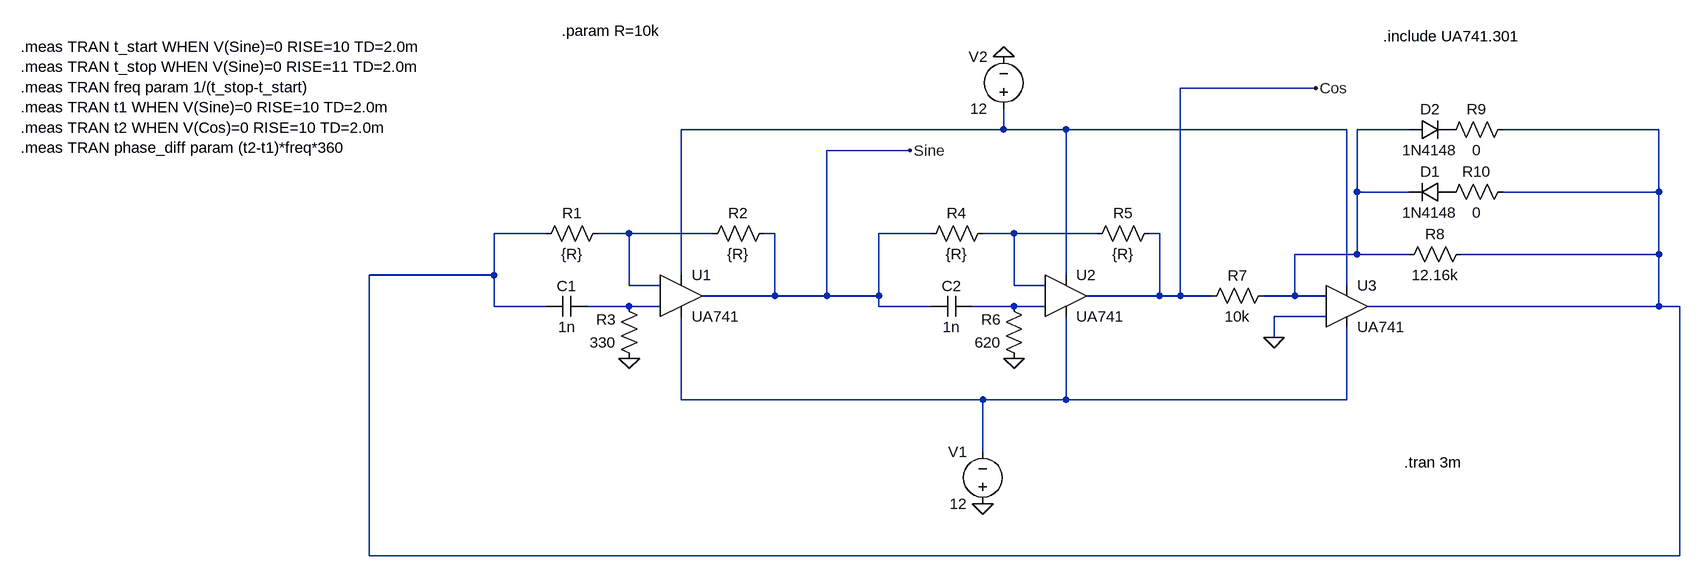
[diagram p0: schematic Quadrature_Oscillator.asc]
Quadrature_Oscillator.asc, the LTspice schematic file:
Version 4.1
SHEET 1 1748 680
WIRE 1120 -176 912 -176
WIRE 640 -112 640 -144
WIRE 640 -112 144 -112
WIRE 736 -112 640 -112
WIRE 1168 -112 736 -112
WIRE 1264 -112 1184 -112
WIRE 1648 -112 1408 -112
WIRE 496 -80 368 -80
WIRE 1184 -16 1184 -112
WIRE 1264 -16 1184 -16
WIRE 1648 -16 1648 -112
WIRE 1648 -16 1408 -16
WIRE -64 48 -144 48
WIRE 64 48 16 48
WIRE 192 48 64 48
WIRE 288 48 272 48
WIRE 528 48 448 48
WIRE 656 48 608 48
WIRE 784 48 656 48
WIRE 880 48 864 48
WIRE 1184 80 1184 -16
WIRE 1184 80 1088 80
WIRE 1264 80 1184 80
WIRE 1648 80 1648 -16
WIRE 1648 80 1344 80
WIRE -144 112 -144 48
WIRE -144 112 -336 112
WIRE 144 112 144 -112
WIRE 736 112 736 -112
WIRE 64 128 64 48
WIRE 112 128 64 128
WIRE 656 128 656 48
WIRE 704 128 656 128
WIRE 1168 128 1168 -112
WIRE 288 144 288 48
WIRE 288 144 176 144
WIRE 368 144 368 -80
WIRE 368 144 288 144
WIRE 448 144 448 48
WIRE 448 144 368 144
WIRE 880 144 880 48
WIRE 880 144 768 144
WIRE 912 144 912 -176
WIRE 912 144 880 144
WIRE 960 144 912 144
WIRE 1088 144 1088 80
WIRE 1088 144 1040 144
WIRE 1136 144 1088 144
WIRE -144 160 -144 112
WIRE -64 160 -144 160
WIRE 64 160 0 160
WIRE 112 160 64 160
WIRE 448 160 448 144
WIRE 528 160 448 160
WIRE 656 160 592 160
WIRE 704 160 656 160
WIRE 1648 160 1648 80
WIRE 1648 160 1200 160
WIRE 1680 160 1648 160
WIRE 1136 176 1056 176
WIRE 1056 208 1056 176
WIRE 144 304 144 176
WIRE 608 304 144 304
WIRE 736 304 736 176
WIRE 736 304 608 304
WIRE 1168 304 1168 192
WIRE 1168 304 736 304
WIRE 608 384 608 304
WIRE -336 544 -336 112
WIRE 1680 544 1680 160
WIRE 1680 544 -336 544
FLAG 64 240 0
FLAG 656 240 0
FLAG 496 -80 Sine
FLAG 1120 -176 Cos
FLAG 608 464 0
FLAG 640 -224 0
FLAG 1056 208 0
SYMBOL UA741 144 80 R0
SYMATTR InstName U1
SYMBOL res 32 32 R90
WINDOW 0 0 56 VBottom 2
WINDOW 3 32 56 VTop 2
SYMATTR InstName R1
SYMATTR Value {R}
SYMBOL res 288 32 R90
WINDOW 0 0 56 VBottom 2
WINDOW 3 32 56 VTop 2
SYMATTR InstName R2
SYMATTR Value {R}
SYMBOL cap -64 176 R270
WINDOW 0 32 32 VTop 2
WINDOW 3 0 32 VBottom 2
SYMATTR InstName C1
SYMATTR Value 1n
SYMBOL res 80 256 R180
WINDOW 0 36 76 Left 2
WINDOW 3 36 40 Left 2
SYMATTR InstName R3
SYMATTR Value 330
SYMBOL UA741 736 80 R0
SYMATTR InstName U2
SYMBOL res 624 32 R90
WINDOW 0 0 56 VBottom 2
WINDOW 3 32 56 VTop 2
SYMATTR InstName R4
SYMATTR Value {R}
SYMBOL res 880 32 R90
WINDOW 0 0 56 VBottom 2
WINDOW 3 32 56 VTop 2
SYMATTR InstName R5
SYMATTR Value {R}
SYMBOL cap 528 176 R270
WINDOW 0 32 32 VTop 2
WINDOW 3 0 32 VBottom 2
SYMATTR InstName C2
SYMATTR Value 1n
SYMBOL res 672 256 R180
WINDOW 0 36 76 Left 2
WINDOW 3 36 40 Left 2
SYMATTR InstName R6
SYMATTR Value 620
SYMBOL UA741 1168 96 R0
SYMATTR InstName U3
SYMBOL res 1056 128 R90
WINDOW 0 0 56 VBottom 2
WINDOW 3 32 56 VTop 2
SYMATTR InstName R7
SYMATTR Value 10k
SYMBOL voltage 608 480 R180
WINDOW 0 24 96 Left 2
WINDOW 3 24 16 Left 2
SYMATTR InstName V1
SYMATTR Value 12
SYMBOL voltage 640 -128 R180
WINDOW 0 24 96 Left 2
WINDOW 3 24 16 Left 2
SYMATTR InstName V2
SYMATTR Value 12
SYMBOL res 1360 64 R90
WINDOW 0 0 56 VBottom 2
WINDOW 3 32 56 VTop 2
SYMATTR InstName R8
SYMATTR Value 12.16k
SYMBOL diode 1328 -32 R90
WINDOW 0 0 32 VBottom 2
WINDOW 3 32 32 VTop 2
SYMATTR InstName D1
SYMATTR Value 1N4148
SYMBOL diode 1264 -96 R270
WINDOW 0 32 32 VTop 2
WINDOW 3 0 32 VBottom 2
SYMATTR InstName D2
SYMATTR Value 1N4148
SYMBOL res 1424 -128 R90
WINDOW 0 0 56 VBottom 2
WINDOW 3 32 56 VTop 2
SYMATTR InstName R9
SYMATTR Value 0
SYMBOL res 1424 -32 R90
WINDOW 0 0 56 VBottom 2
WINDOW 3 32 56 VTop 2
SYMATTR InstName R10
SYMATTR Value 0
TEXT 1256 400 Left 2 !.tran 3m
TEXT 1224 -256 Left 2 !.include UA741.301
TEXT -40 -264 Left 2 !.param R=10k
TEXT -872 -240 Left 2 !.meas TRAN t_start WHEN V(Sine)=0 RISE=10 TD=2.0m\n.meas TRAN t_stop WHEN V(Sine)=0 RISE=11 TD=2.0m\n.meas TRAN freq param 1/(t_stop-t_start)\n.meas TRAN t1 WHEN V(Sine)=0 RISE=10 TD=2.0m\n.meas TRAN t2 WHEN V(Cos)=0 RISE=10 TD=2.0m\n.meas TRAN phase_diff param (t2-t1)*freq*360

The netlist it stands for:
* Quadrature_Oscillator.asc
X§U1 N006 N004 N001 N008 Sine UA741  ; pins In+ In- V+ V- OUT
R1 N004 N003 {R}
R2 Sine N004 {R}
C1 N003 N006 1n
R3 0 N006 330
X§U2 N007 N005 N001 N008 Cos UA741  ; pins In+ In- V+ V- OUT
R4 N005 Sine {R}
R5 Cos N005 {R}
C2 Sine N007 1n
R6 0 N007 620
X§U3 0 N002 N001 N008 N003 UA741  ; pins In+ In- V+ V- OUT
R7 N002 Cos 10k
V1 0 N008 12
V2 N001 0 12
R8 N003 N002 12.16k
D1 P001 N002 1N4148
D2 N002 P002 1N4148
R9 N003 P002 0
R10 N003 P001 0
.model D D
.lib standard.dio
.tran 3m
.include UA741.301
.param R=10k
.meas TRAN t_start WHEN V(Sine)=0 RISE=10 TD=2.0m
.meas TRAN t_stop WHEN V(Sine)=0 RISE=11 TD=2.0m
.meas TRAN freq param 1/(t_stop-t_start)
.meas TRAN t1 WHEN V(Sine)=0 RISE=10 TD=2.0m
.meas TRAN t2 WHEN V(Cos)=0 RISE=10 TD=2.0m
.meas TRAN phase_diff param (t2-t1)*freq*360
.backanno
.end